# Altium schematic sheet ECG_FrontEnd.SchDoc
size B; SheetNumber: 1; SheetTotal: 1
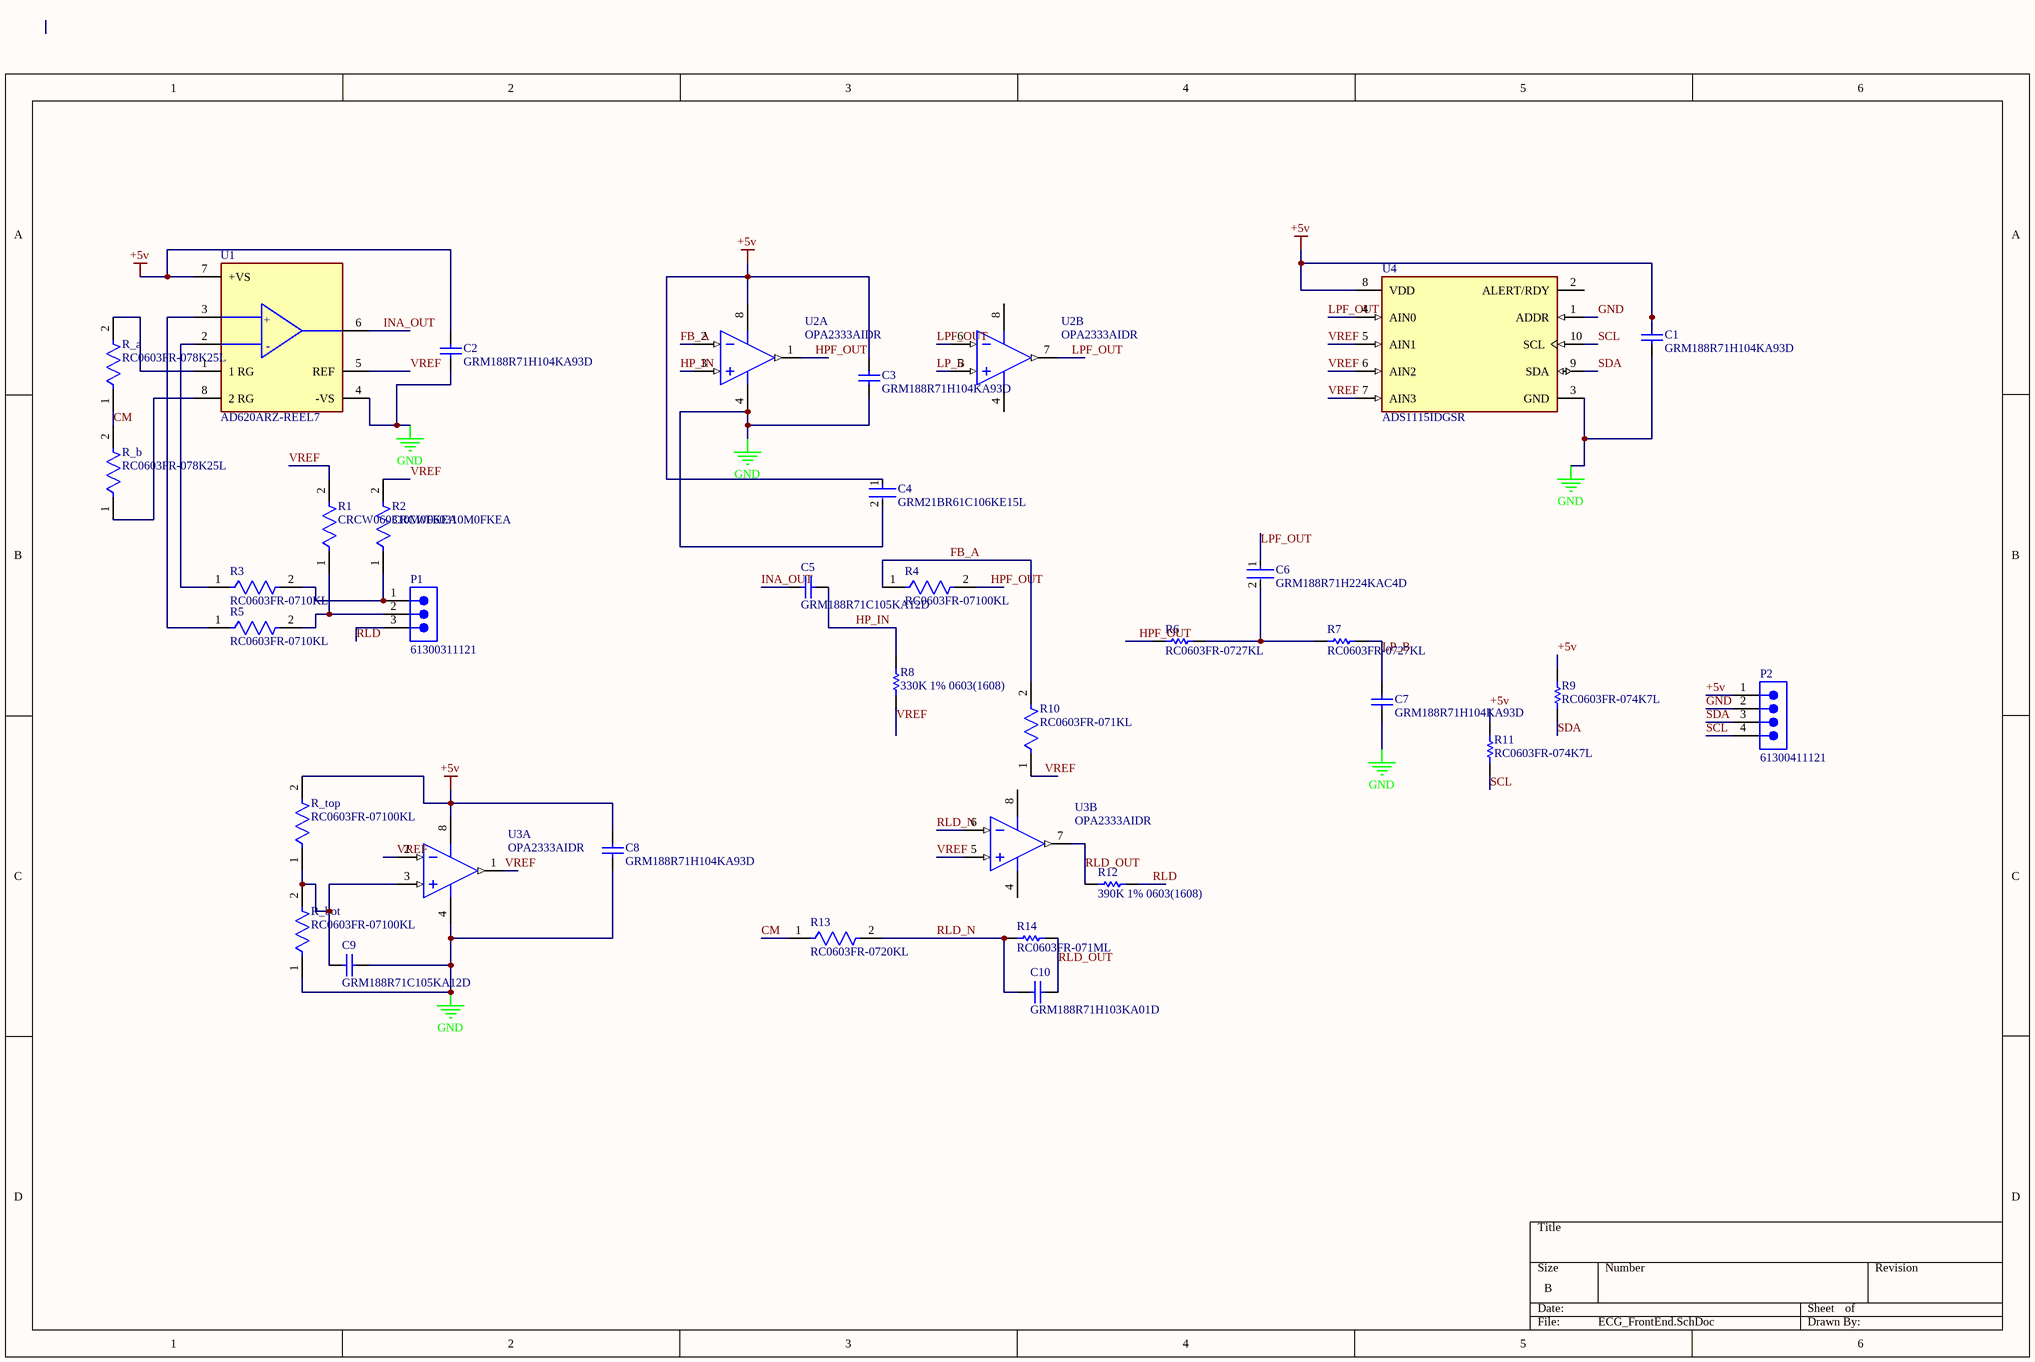
[diagram p0: ECG_FrontEnd.SchDoc]

## Parts
C1  GRM188R71H104KA93D  [CAPC1608X90X35ML10T15]
C2  GRM188R71H104KA93D  [CAPC1608X90X35ML10T15]
C3  GRM188R71H104KA93D  [CAPC1608X90X35ML10T15]
C4  GRM21BR61C106KE15L  [FP-GRM21B-0_1-IPC_C]
C5  GRM188R71C105KA12D  [CAPC1608X90X35ML10T15]
C6  GRM188R71H224KAC4D  [FP-GRM188-0_1-e0_2_0_5-IPC_C]
C7  GRM188R71H104KA93D  [CAPC1608X90X35ML10T15]
C8  GRM188R71H104KA93D  [CAPC1608X90X35ML10T15]
C9  GRM188R71C105KA12D  [CAPC1608X90X35ML10T15]
C10  GRM188R71H103KA01D  [CAPC1608X90X35ML10T15]
P1  61300311121  [61300311121]
P2  61300411121  [61300411121]
R1  CRCW060310M0FKEA  [FP-CRCW0603-e3-IPC_A]
R2  CRCW060310M0FKEA  [FP-CRCW0603-e3-IPC_A]
R3  RC0603FR-0710KL  [FP-RC0603-0_55-IPC_C]
R4  RC0603FR-07100KL  [FP-RC0603-0_55-MFG]
R5  RC0603FR-0710KL  [FP-RC0603-0_55-IPC_C]
R6  RC0603FR-0727KL  [RESC1608X55X25LL10T15]
R7  RC0603FR-0727KL  [RESC1608X55X25LL10T15]
R8  330K 1% 0603(1608)  [RESC0603(1608)_M]
R9  RC0603FR-074K7L  [RESC1608X55X25LL10T15]
R10  RC0603FR-071KL  [FP-RC0603-0_55-IPC_C]
R11  RC0603FR-074K7L  [RESC1608X55X25LL10T15]
R12  390K 1% 0603(1608)  [RESC0603(1608)_L]
R13  RC0603FR-0720KL  [FP-RC0603-0_55-IPC_C]
R14  RC0603FR-071ML  [RESC1608X55X25LL10T15]
R_a  RC0603FR-078K25L  [FP-RC0603-0_55-IPC_B]
R_b  RC0603FR-078K25L  [FP-RC0603-0_55-IPC_B]
R_bot  RC0603FR-07100KL  [FP-RC0603-0_55-MFG]
R_top  RC0603FR-07100KL  [FP-RC0603-0_55-MFG]
U1  AD620ARZ-REEL7  [FP-R-8-IPC_B]
U2  OPA2333AIDR  [D0008A_N]  (parts A,B of 2)
U3  OPA2333AIDR  [D0008A_N]  (parts A,B of 2)
U4  ADS1115IDGSR  [FP-DGS0010A-IPC_B]

## Nets
+5v: C1.2 C2.2 C3.2 C4.1 C8.2 P2.1 R9.2 R11.2 R_top.2 U1.7(+VS) U2.8(V+) U3.8(V+) U4.8(VDD)
GND: C1.1 C2.1 C3.1 C4.2 C7.1 C8.1 C9.2 P2.2 R_bot.1 U1.4(-VS) U2.4(V-) U3.4(V-) U4.1(ADDR) U4.3(GND)
CM: R13.1 R_a.1 R_b.2
FB_A: R4.1 R10.2 U2.2(IN_A-)
HP_IN: C5.2 R8.2 U2.3(IN_A+)
HPF_OUT: R4.2 R6.1 U2.1(OUT_A)
INA_OUT: C5.1 U1.6(OUTPUT)
LP_B: C7.2 R7.2 U2.5(IN_B+)
LPF_OUT: C6.1 U2.6(IN_B-) U2.7(OUT_B) U4.4(AIN0)
RLD: P1.3 R12.2
RLD_N: C10.1 R13.2 R14.1 U3.6(IN_B-)
RLD_OUT: C10.2 R12.1 R14.2 U3.7(OUT_B)
SCL: P2.4 R11.1 U4.10(SCL)
SDA: P2.3 R9.1 U4.9(SDA)
VREF: R1.2 R2.2 R8.1 R10.1 U1.5(REF) U3.1(OUT_A) U3.2(IN_A-) U3.5(IN_B+) U4.5(AIN1) U4.6(AIN2) U4.7(AIN3)
NetC6_2: C6.2 R6.2 R7.1
NetC9_1: C9.1 R_bot.2 R_top.1 U3.3(IN_A+)
NetP1_1: P1.1 R2.1 R3.2
NetP1_2: P1.2 R1.1 R5.2
NetR3_1: R3.1 U1.2(-IN)
NetR5_1: R5.1 U1.3(+IN)
NetR_a_2: R_a.2 U1.1(1_RG)
NetR_b_1: R_b.1 U1.8(2_RG)

Not connected (* = marked no-connect by the designer): U4 2(ALERT/RDY)

## Notes on the sheet
- (in symbol CMP-09116-000354-1) +

## Library data of the parts
C1-C3 C7 C8 = CMP-2100-03643-1: Chip Capacitor, 0.1 uF, +/- 10%, 50 V, -55 to 125 degC, 0603 (1608 Metric), RoHS, Tape and Reel; Manufacturer: Murata; Dielectric Material: Ceramic; Voltage Rating: 50V; Capacitance: 100nF; Dielectric: X7R; Insulation Resistance: 10GR; Case Code (Metric): 1608; Lead Free: LeadFree; Depth: 0.8mm; Number of Pins: 2; Radiation Hardening: No; Case/Package: 0603; Manufacturer URL: http://www.murata.com/; Packaging: TapeandReel; Length: 1.6mm; Contact Plating: Tin; Datasheet URL: http://psearch.en.murata.com/capacitor/product/GRM188R71H104KA93%23.pdf; Tolerance: 10%; Case Code (Imperial): 0603; Min Operating Temperature: -55degC; RoHSCompliant: true; Voltage: 50V; Termination: SMD/SMT; Mount: SurfaceMount; Material: Ceramic; Package Quantity: 1; Height: 0.8mm; Thickness: 0.035inch; REACH SVHC: NoSVHC; Max Operating Temperature: 125degC; Width: 0.8mm; Package Reference: 0603; Voltage Rating (DC): 50V; Datasheet Version: 42675.0; Package Description: 2-Pin Surface Mount Device, Body 1.6 x 0.8 mm
C4 = CMP-2007-03453-2: Chip Multilayer Ceramic Capacitors for General Purpose, 0805, 10uF, X5R, 15%, 10%, 16V; Radiation Hardening: No; Thickness: 0.053inch; Voltage Rating (DC): 16V; Lead Free: Lead Free; Package Quantity: 1; Width: 1.25mm; Case Code (Imperial): 0805; Depth: 1.25mm; Packaging: Tape and Reel; Dielectric: X5R; Max Operating Temperature: 85°C; Tolerance: 10%; Voltage Rating: 16V; Voltage: 16V; Capacitance: 10uF; Height: 1.25mm; Case Code (Metric): 2012; Material: Ceramic; Mount: Surface Mount; Case/Package: 0805; REACH SVHC: No SVHC; Length: 2mm; Min Operating Temperature: -55°C; Termination: SMD/SMT
C5 C9 = CMP-2006-02845-1: Manufacturer: Murata; Part Number: GRM188R71C105KA12D
C6 = CMP-06035-003691-1: Chip Multilayer Ceramic Capacitors for General Purpose, 0603, 0.22uF, X7R, 15%, 10%, 50V; Capacitance: 220nF; Lead Free: Lead Free; Packaging: Tape and Reel; Max Operating Temperature: 125°C; Tolerance: 10%; Case Code (Imperial): 0603; Case/Package: 0603; Thickness: 0.035inch; Case Code (Metric): 1608; Voltage Rating (DC): 50V; Width: 0.031inch; Mount: Surface Mount; Voltage Rating: 50V; Length: 0.063inch; Min Operating Temperature: -55°C
C10 = CMP-2100-03642-1: Chip Capacitor, 10 nF, +/- 10%, 50 V, -55 to 125 degC, 0603 (1608 Metric), RoHS, Tape and Reel; Manufacturer: Murata; Insulation Resistance: 10GR; Dielectric: X7R; Voltage Rating: 50V; Capacitance: 10nF; Material: Ceramic; Package Quantity: 1; Lead Free: LeadFree; Case/Package: 0603; Termination: SMD/SMT; REACH SVHC: Unknown; Manufacturer URL: http://www.murata.com/; Datasheet URL: http://search.murata.co.jp/Ceramy/image/img/A01X/G101/ENG/GRM188R71H103KA01-01.pdf; Mount: SurfaceMount; Datasheet Version: 42401.0; Number of Pins: 2; Length: 1.6mm; Voltage: 50V; Depth: 0.8mm; Tolerance: 10%; Min Operating Temperature: -55degC; Voltage Rating (DC): 50V; Max Operating Temperature: 125degC; Package Description: 2-Pin Surface Mount Device, Body 1.6 x 0.8 mm; RoHSCompliant: True; Case Code (Imperial): 0603; Width: 0.031inch; Case Code (Metric): 1608; Height: 0.8mm; Package Reference: 0603; Packaging: TapeandReel; Thickness: 0.035inch; Dielectric Material: Ceramic
P1 = CMP-1502-01062-4: THT Vertical Pin Header WR-PHD, Pitch 2.54 mm, Single Row, 3 pins; Connector Type: Male Pin; Number of Contacts: 3; Operating Supply Voltage: 250V; Current Rating: 3A; Pitch: 2.54mm; Contact Resistance: 20mΩ; Gender: Male; Height: 8.94mm; Color: Black; Min Operating Temperature: -40°C; Max Operating Temperature: 105°C; Mount: Through Hole; Termination: Solder; Number of Rows: 1; Packaging: Bulk; Number of Pins: 3; Lead Pitch: 2.54mm; RoHS: Compliant; Contact Plating: Gold; Number of Positions: 3; Lead Free: Lead Free; Voltage Rating: 250V; Contact Mating Length: 5.9944mm; Orientation: Vertical; Contact Material: Gold
P2 = CMP-1502-01064-4: THT Vertical Pin Header WR-PHD, Pitch 2.54 mm, Single Row, 4 pins; Connector Type: Male Pin; Gender: Male; Current Rating: 3A; Number of Positions: 4; Operating Supply Voltage: 250V; Contact Resistance: 20mΩ; Pitch: 2.54mm; Max Operating Temperature: 105°C; Mount: Through Hole; Contact Material: Gold; Contact Plating: Gold; Number of Contacts: 4; Orientation: Vertical; Packaging: Bulk; Contact Mating Length: 5.9944mm; Voltage Rating: 250V; Number of Rows: 1; Height: 8.89mm; Lead Free: Lead Free; Lead Pitch: 2.54mm; Number of Pins: 4; Color: Black; Min Operating Temperature: -40°C; RoHS: Compliant; Termination: Solder
R1 R2 = CMP-2000-03843-2: RES Thick Film, 10MΩ, 1%, 0.1W, 100ppm/°C, 0603; Voltage Rating: 75V; Power Rating: 100mW; Resistance: 10MR; Packaging: Tape and Reel; Depth: 0.85mm; Package Quantity: 5000; Case/Package: 0603; Tolerance: 1%; Case Code (Imperial): 0603; Weight: 7.1E-05oz; Radiation Hardening: No; Composition: Thick Film; Contact Plating: Tin; Max Operating Temperature: 155°C; Military Standard: Not; Case Code (Metric): 1608; Min Operating Temperature: -55°C; Number of Terminations: 2; Mount: Surface Mount; Height: 0.45mm; Lead Free: Lead Free; Voltage Rating (DC): 75V; Width: 0.85mm; Length: 1.55mm; Working Voltage: 75V; Temperature Coefficient: 100ppm/°C; Termination: SMD/SMT
R3 R5 = CMP-2100-03664-2: RES 10K OHM 1% 1/10W 0603; Voltage Rating: 75V; Voltage Rating (DC): 50V; Resistance: 10kR; Power Rating: 100mW; Temperature Coefficient: 100ppm/°C; Depth: 0.8mm; Termination: SMD/SMT; Resistor Type: Thick Film; Series: RC; Construction: Rectangular; Features: Moisture Resistant; Packaging: Tape and Reel; Min Operating Temperature: -55°C; Number of Terminations: 2; Lead Pitch: 0.3mm; RoHS Compliant: Yes; Case/Package: 0603; Resistance Tolerance: 1%; Military Standard: Not; Weight: 7.1E-05oz; Number of Pins: 2; Tolerance: 1%; Length: 1.6mm; Case Code (Imperial): 0603; Lead Free: Lead Free; Width: 0.8mm; Max Power Dissipation: 100mW; Height: 0.45mm; Max Operating Temperature: 155°C; Case Code (Metric): 1608; Size Code: 0603
R4 R_bot R_top = CMP-2100-03662-2: RES SMD 100K OHM 1% 1/10W 0603; Voltage Rating (DC): 50V; Resistance: 100kR; Max Power Dissipation: 100mW; Temperature Coefficient: 100ppm/°C; Working Voltage: 75V; Length: 1.6mm; Lead Free: Lead Free; Number of Terminations: 2; Packaging: Tape and Reel; Voltage Rating: 50V; Termination: SMD/SMT; Width: 0.8mm; Resistor Type: Thick Film; Resistance Tolerance: 1%; Features: Moisture Resistant; Height: 0.45mm; Construction: Rectangular; Case/Package: 0603; Military Standard: Not; Case Code (Imperial): 0603; Series: RC; Technology: THICK FILM; Depth: 0.8mm; RoHS Compliant: Yes; REACH SVHC: No SVHC; Min Operating Temperature: -55°C; Case Code (Metric): 1608; Max Operating Temperature: 155°C; Power Rating: 100mW; Number of Pins: 2; Tolerance: 1%
R6 R7 = CMP-2000-06933-1: Chip Resistor, 27 KOhm, +/- 1%, 0.1 W, -55 to 155 degC, 0603 (1608 Metric), RoHS, Tape and Reel; Manufacturer: Yageo; Resistance: 27kOhms; Temperature Coefficient: 100PPM/C; Power Rating: 100mW; Voltage Rating: 50V; Mounting Technology: SurfaceMount; Operating Temperature Range: -55Cto+155C; Case Code - in: 0603; Product: ThickFilmResistorsGeneralPurpose; Package Reference: 0603; Datasheet Version: Rev. 7, 05/2017; Tolerance: 1%; Manufacturer URL: http://www.yageo.com/; Termination Style: SMD/SMT; Packaging: Reel; Series: RC; Package Description: 2-Pin Surface Mount Device, Body 1.6 x 0.8 mm; Datasheet URL: http://www.yageo.com/documents/recent/PYu-RC_Group_51_RoHS_L_7.pdf; Case Code - mm: 1608
R8 = CMP-1012-00793-1: 330K 0.1W 1% 0603 (1608 Metric)  SMD; Case-EIA: 0603; Case-Metric: 1608; Value: 330000.00 Ohm; Power: 0.1 W; Technology: SMT; Tolerance: 1 %
R9 R11 = CMP-2000-06942-1: Chip Resistor, 4.7 KOhm, +/- 1%, 0.1 W, -55 to 155 degC, 0603 (1608 Metric), RoHS, Tape and Reel; Manufacturer: Yageo; Power Rating: 100mW; Temperature Coefficient: 100PPM/C; Resistance: 4.7kOhms; Voltage Rating: 50V; Package Reference: 0603; Series: RC; Datasheet Version: Rev. 7, 05/2017; Packaging: Reel; Termination Style: SMD/SMT; Datasheet URL: http://www.yageo.com/documents/recent/PYu-RC_Group_51_RoHS_L_7.pdf; Manufacturer URL: http://www.yageo.com/; Package Description: 2-Pin Surface Mount Device, Body 1.6 x 0.8 mm; Case Code - mm: 1608; Case Code - in: 0603; Mounting Technology: SurfaceMount; Operating Temperature Range: -55Cto+155C; Tolerance: 1%; Product: ThickFilmResistorsGeneralPurpose
R10 = CMP-1659-00009-5: RES 1K OHM 1% 1/10W 0603; Resistance: 1kR; Voltage Rating: 50V; Power Rating: 100mW; Temperature Coefficient: 100ppm/°C; Military Standard: Not; REACH SVHC: No SVHC; Size Code: 0603; Features: Moisture Resistant; Number of Terminations: 2; Technology: THICK FILM; Series: RC; Case Code (Metric): 1608; Resistance Tolerance: 1%; Resistor Type: Thick Film; Termination: SMD/SMT; Contact Plating: Tin; Radiation Hardening: No; Min Operating Temperature: -55°C; Max Operating Temperature: 155°C; Packaging: Tape and Reel; Max Power Dissipation: 100mW; RoHS Compliant: Yes; Height: 0.45mm; Lead Free: Lead Free; Case/Package: 0603; Length: 1.6mm; Tolerance: 1%; Case Code (Imperial): 0603; Construction: Rectangular; Depth: 0.8mm
R12 = CMP-1012-00802-1: 390K 0.1W 1% 0603 (1608 Metric)  SMD; Case-EIA: 0603; Case-Metric: 1608; Value: 390000.00 Ohm; Power: 0.1 W; Technology: SMT; Tolerance: 1 %
R13 = CMP-2000-06932-2: RES 20K OHM 1% 1/10W 0603; Voltage Rating: 50V; Temperature Coefficient: 100ppm/°C; Power Rating: 100mW; Resistance: 20kR; Height: 0.022inch; REACH SVHC: No SVHC; Case Code (Metric): 1608; Depth: 0.8mm; Tolerance: 1%; Min Operating Temperature: -55°C; Series: RC; RoHS Compliant: Yes; Resistor Type: Thick Film; Max Power Dissipation: 100mW; Features: Moisture Resistant; Max Operating Temperature: 155°C; Package Quantity: 1; Size Code: 0603; Packaging: Tape and Reel; Width: 0.031inch; Length: 0.063inch; Military Standard: Not; Technology: THICK FILM; Number of Terminations: 2; Termination: SMD/SMT; Construction: Rectangular; Case/Package: 0603; Number of Pins: 2; Lead Free: Lead Free; Voltage Rating (DC): 50V; Resistance Tolerance: 1%; Case Code (Imperial): 0603
R14 = CMP-1659-00056-1: Chip Resistor, 1 MOhm, +/- 1%, 100 mW, -55 to 155 degC, 0603 (1608 Metric), RoHS, Tape and Reel; Voltage Rating (DC): 25 V; Tolerance: 20%; Case\Package: Radial; Capacitance: 1 mF; Min Operating Temperature: -40 degC; PackageDescription: 2-Pin Surface Mount Device, Body 1.6 x 0.8 mm; ComponentLink1Description: Manufacturer URL; Radiation Hardening: No; DatasheetVersion: Rev. 4, 02/2016; REACH SVHC: No SVHC; Length: 20 mm; Max Operating Temperature: 85 degC; Diameter: 10 mm; Packaging: Bulk; Package Quantity: 200; PackageReference: 0603; Mount: Through Hole; ComponentLink1URL: http://www.yageo.com/; ComponentLink2URL: http://www.yageo.com/documents/recent/PYu-RC_Group_51_RoHS_L_04.pdf; ComponentLink2Description: Datasheet; Width: 0 inch; Lead Pitch: 5 mm; RoHSCompliant: true; Voltage Rating: 25 V; Height: 20 mm
R_a R_b = CMP-03412-037838-1: RES 8.25K OHM 1% 1/10W 0603; Temperature Coefficient: 100ppm/°C; Max Power Dissipation: 100mW; Voltage Rating (DC): 50V; Resistance: 8.25kR; Series: RC; Case/Package: 0603; Depth: 0.8mm; RoHS Compliant: Yes; Technology: THICK FILM; Case Code (Metric): 1608; Resistor Type: Thick Film; Max Operating Temperature: 155°C; Military Standard: Not; Length: 1.6mm; Number of Terminations: 2; Height: 0.45mm; Mount: Surface Mount; Packaging: Tape and Reel; Case Code (Imperial): 0603; Tolerance: 1%; Width: 0.031inch; Construction: Rectangular; Package Quantity: 1; Min Operating Temperature: -55°C; Size Code: 0603; Termination: SMD/SMT; Lead Free: Lead Free; Power Rating: 100mW; Features: Moisture Resistant; Voltage Rating: 50V
U1 = CMP-09116-000354-1: IC INST AMP 1 CIRCUIT 8SOIC; Input Resistance: 10GR; Bandwidth: 800kHz; Dual Supply Voltage: 15V; Number of Channels: 1; Power Dissipation: 650mW; Input Bias Current: 500pA; Common Mode Rejection Ratio: 93dB; Slew Rate: 1.2V/µs; Supply Current: 900uA; Input Offset Voltage (Vos): 30mV; Min Dual Supply Voltage: 2.3V; Min Supply Voltage: 4.6V; Power Supply Rejection Ratio (PSRR): 140dB; Operating Supply Voltage: 18V; Output Current per Channel: 18mA; -3db Bandwidth: 1MHz; Operating Supply Current: 1.3mA; Mount: Surface Mount; RoHS Compliant: Yes; Max Operating Temperature: 125°C; Radiation Hardening: No; Packaging: Tape and Reel; Nominal Supply Current: 900uA; Contact Plating: Tin; Number of Elements: 1; Number of Circuits: 1; Series: -; Case/Package: SOIC; Package Quantity: 1; Max Dual Supply Voltage: 18V; Min Operating Temperature: -55°C; Lead Free: Contains Lead; Number of Pins: 8; Max Power Dissipation: 650mW
U2 U3 = CMP-0272-00762-3: 17 uA, MicroPower, Precision, Zero Drift CMOS Operational Amplifier, 1.8 to 5.5 V, -40 to 125 degC, 8-pin SOIC (D8), Green (RoHS & no Sb/Br); Manufacturer: Texas Instruments; Iq per channel(Max)(mA): 0.025; IIB(Max)(pA): 200; Total Supply Voltage(Min)(+5V is 5, +/-5V is 10): 1.8; Sub Family: Low Offset Voltage Amplifier (<=500uV), Low Power Amp (<=500uA), Low Supply Voltage Amplifier (<=2.7V), Precision Amplifier, Zero Drift Precision Amplifier; Vio (25C)(Max)(mV): 0.01; Offset Drift(Typ)(uV/C): 0.02; Slew Rate(Typ)(V/us): 0.16; Total Supply Voltage(Max)(+5V is 5, +/-5V is 10): 5.5; Number of Channels: 2; CMRR(Min)(dB): 106; ComponentLink1URL: http://www.ti.com/; ComponentLink3URL: http://www.ti.com/litv/pdf/msoi002j; PackageDescription: 8-Pin Plastic Small Outline, Body 4.9 x 3.9 mm, Pitch 1.27 mm; PartNumber: OPA2333AIDR; PackageReference: D0008A; Code_JEDEC: MS-012; Eco-Plan: Green (RoHS & no Sb/Br); ComponentLink2URL: http://www.ti.com/general/docs/lit/getliterature.tsp?genericPartNumber=OPA2333&fileType=pdf; ComponentLink2Description: Datasheet; PackageVersion: 4040047-3/M, 06/2011; ComponentLink1Description: Manufacturer URL; Mounting Technology: Surface Mount; DatasheetVersion: SBOS351C; ComponentLink3Description: Package Specification
U4 = CMP-0003-00385-3: IC ADC 16BIT SIGMA-DELTA 10VSSOP; Max Supply Voltage (DC): 5.5V; Resolution: 16b; Interface: I2C; Number of Inputs: 4; Sampling Rate: 860S/s; Integral Nonlinearity (INL): 1LSB; Min Supply Voltage: 2V; Polarity: Bipolar; Conversion Rate: 0.86KS/s; Supply Type: Single; Number of Converters: 1; Number of Bits: 16; Power Dissipation: 900uW; Case/Package: VSSOP; Contact Plating: Gold; RoHS Compliant: Yes; Max Operating Temperature: 125°C; Lead Free: Lead Free; Package Quantity: 2500; Series: -; Min Supply Voltage (DC): 2V; REACH SVHC: No SVHC; Packaging: Tape and Reel; Max Supply Voltage: 5.5V; Radiation Hardening: No; Min Operating Temperature: -40°C; Number of Pins: 10; Number of A/D Converters: 1